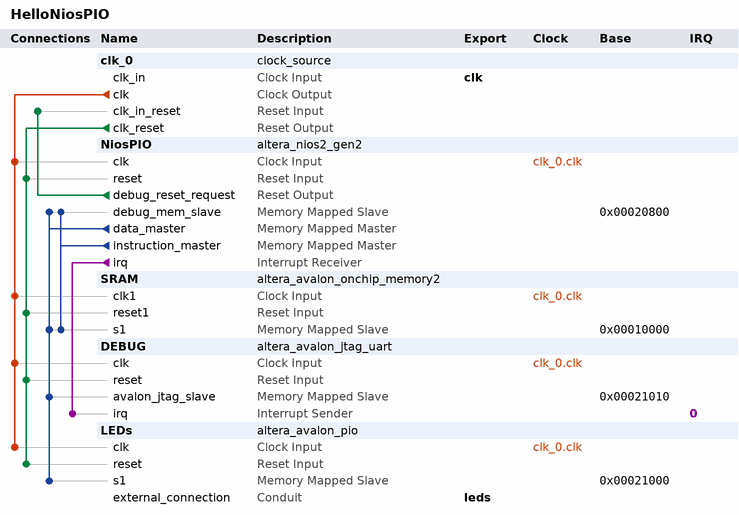
[diagram p0: system contents]
# Platform Designer (Qsys) system HelloNiosPIO, Cyclone V 5CSEMA5F31C6
# Parameters at their usual value, and those the tool derives, are not listed.
package require -exact qsys 18.1
create_system HelloNiosPIO
set_project_property DEVICE_FAMILY {Cyclone V}
set_project_property DEVICE 5CSEMA5F31C6

add_instance clk_0 clock_source 18.1
set_instance_parameter_value clk_0 clockFrequency 50000000

add_instance NiosPIO altera_nios2_gen2 18.1
set_instance_parameter_value NiosPIO dcache_size 2048
set_instance_parameter_value NiosPIO exceptionSlave SRAM.s1
set_instance_parameter_value NiosPIO icache_size 4096
set_instance_parameter_value NiosPIO impl Tiny
set_instance_parameter_value NiosPIO resetSlave SRAM.s1

add_instance SRAM altera_avalon_onchip_memory2 18.1
set_instance_parameter_value SRAM dataWidth 32
set_instance_parameter_value SRAM dualPort false
set_instance_parameter_value SRAM initMemContent true
set_instance_parameter_value SRAM initializationFileName onchip_mem.hex
set_instance_parameter_value SRAM memorySize 40960

add_instance DEBUG altera_avalon_jtag_uart 18.1
set_instance_parameter_value DEBUG simInteractiveOptions NO_INTERACTIVE_WINDOWS

add_instance LEDs altera_avalon_pio 18.1
set_instance_parameter_value LEDs direction Output
set_instance_parameter_value LEDs width 10

# connections
add_connection clk_0.clk DEBUG.clk clock
add_connection clk_0.clk LEDs.clk clock
add_connection clk_0.clk NiosPIO.clk clock
add_connection clk_0.clk SRAM.clk1 clock
add_connection clk_0.clk_reset DEBUG.reset reset
add_connection clk_0.clk_reset LEDs.reset reset
add_connection clk_0.clk_reset NiosPIO.reset reset
add_connection clk_0.clk_reset SRAM.reset1 reset
add_connection NiosPIO.debug_reset_request clk_0.clk_in_reset reset
add_connection NiosPIO.data_master DEBUG.avalon_jtag_slave avalon
set_connection_parameter_value NiosPIO.data_master/DEBUG.avalon_jtag_slave baseAddress 0x00021010
add_connection NiosPIO.data_master LEDs.s1 avalon
set_connection_parameter_value NiosPIO.data_master/LEDs.s1 baseAddress 0x00021000
add_connection NiosPIO.data_master NiosPIO.debug_mem_slave avalon
set_connection_parameter_value NiosPIO.data_master/NiosPIO.debug_mem_slave baseAddress 0x00020800
add_connection NiosPIO.data_master SRAM.s1 avalon
set_connection_parameter_value NiosPIO.data_master/SRAM.s1 baseAddress 0x00010000
add_connection NiosPIO.instruction_master NiosPIO.debug_mem_slave avalon
set_connection_parameter_value NiosPIO.instruction_master/NiosPIO.debug_mem_slave baseAddress 0x00020800
add_connection NiosPIO.instruction_master SRAM.s1 avalon
set_connection_parameter_value NiosPIO.instruction_master/SRAM.s1 baseAddress 0x00010000
add_connection NiosPIO.irq DEBUG.irq interrupt
set_connection_parameter_value NiosPIO.irq/DEBUG.irq irqNumber 0

# exported interfaces
add_interface clk clock sink
set_interface_property clk EXPORT_OF clk_0.clk_in
add_interface leds conduit end
set_interface_property leds EXPORT_OF LEDs.external_connection

set_interconnect_requirement {$system} qsys_mm.clockCrossingAdapter HANDSHAKE
set_interconnect_requirement {$system} qsys_mm.enableEccProtection FALSE
set_interconnect_requirement {$system} qsys_mm.insertDefaultSlave FALSE
set_interconnect_requirement {$system} qsys_mm.maxAdditionalLatency 1

save_system HelloNiosPIO.qsys
